# EAGLE design dmxbox2 (EAGLE 9.6.2)
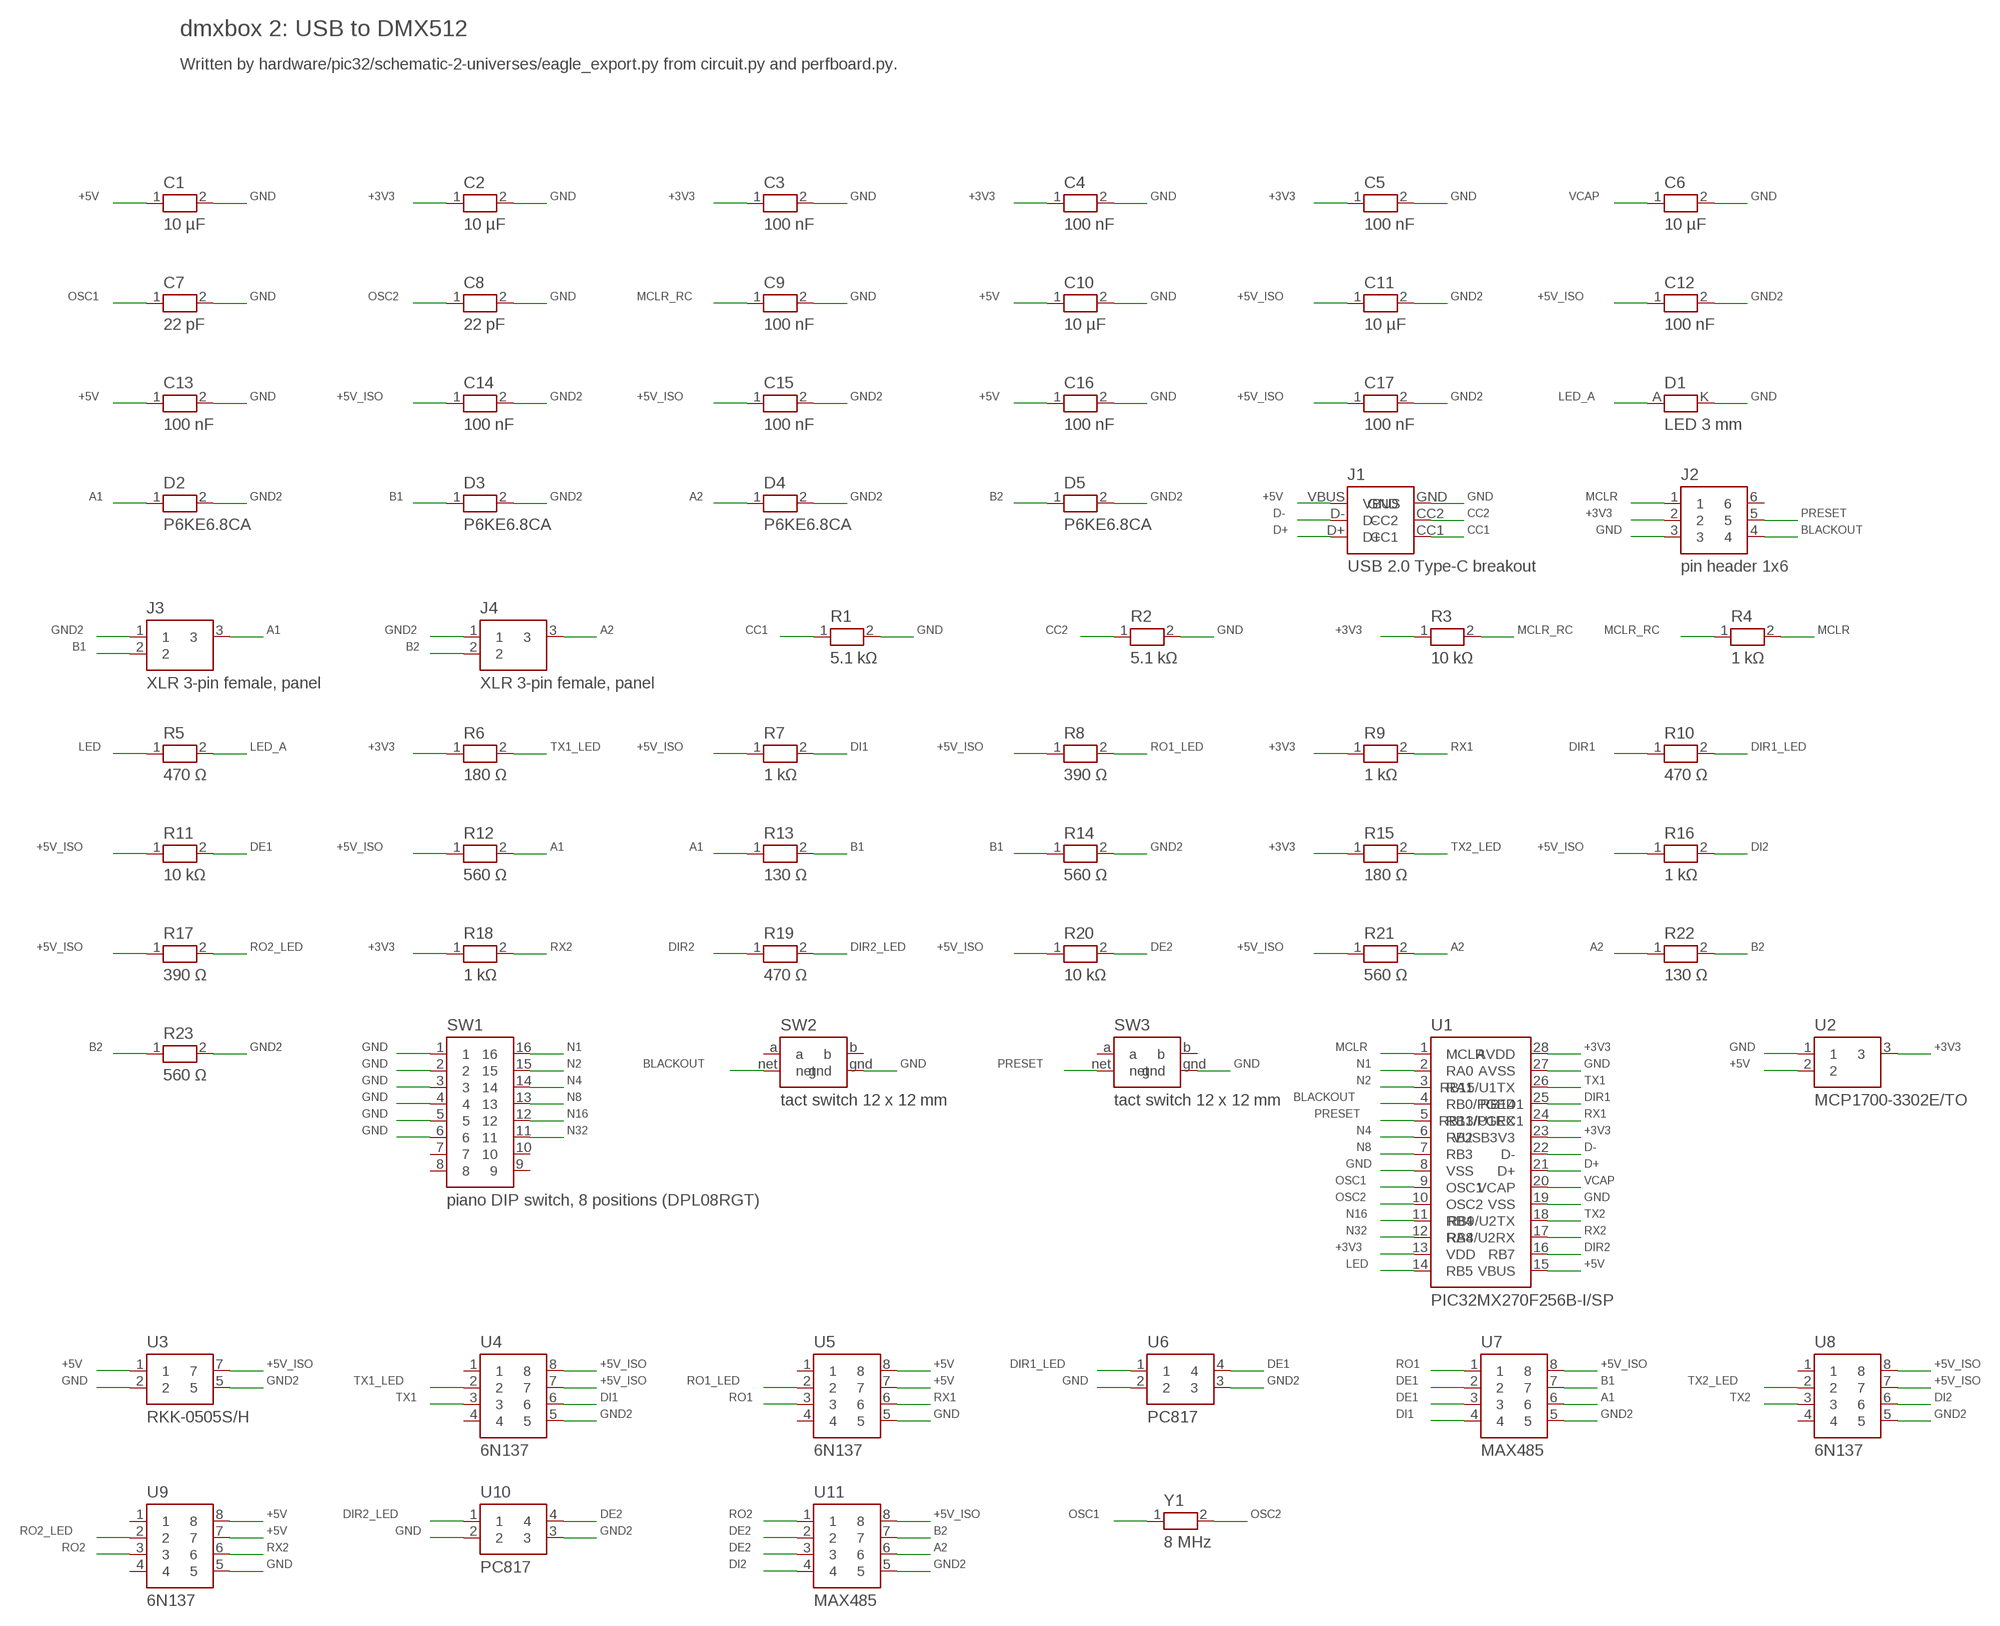
[diagram p0: schematic, sheet 1]

## Parts
C1  10 µF  C_5.08  [C_5.08]
C2  10 µF  C_5.08  [C_5.08]
C3  100 nF  C_5.08  [C_5.08]
C4  100 nF  C_5.08  [C_5.08]
C5  100 nF  C_5.08  [C_5.08]
C6  10 µF  C_5.08  [C_5.08]
C7  22 pF  C_5.08  [C_5.08]
C8  22 pF  C_5.08  [C_5.08]
C9  100 nF  C_5.08  [C_5.08]
C10  10 µF  C_5.08  [C_5.08]
C11  10 µF  C_5.08  [C_5.08]
C12  100 nF  C_5.08  [C_5.08]
C13  100 nF  C_5.08  [C_5.08]
C14  100 nF  C_5.08  [C_5.08]
C15  100 nF  C_5.08  [C_5.08]
C16  100 nF  C_5.08  [C_5.08]
C17  100 nF  C_5.08  [C_5.08]
D1  LED 3 mm  LED_3MM  [LED_3MM]
D2  P6KE6.8CA  DO15_12.70  [DO15_12.70]
D3  P6KE6.8CA  DO15_12.70  [DO15_12.70]
D4  P6KE6.8CA  DO15_12.70  [DO15_12.70]
D5  P6KE6.8CA  DO15_12.70  [DO15_12.70]
J1  USB 2.0 Type-C breakout  USB_C_BREAKOUT_1X6  [USB_C_BREAKOUT_1X6]
J2  pin header 1x6  HEADER_1X6  [HEADER_1X6]
J3  XLR 3-pin female, panel  TERMINAL_3_5.08  [TERMINAL_3_5.08]
J4  XLR 3-pin female, panel  TERMINAL_3_5.08  [TERMINAL_3_5.08]
R1  5.1 kΩ  R_10.16  [R_10.16]
R2  5.1 kΩ  R_10.16  [R_10.16]
R3  10 kΩ  R_10.16  [R_10.16]
R4  1 kΩ  R_5.08_STANDING  [R_5.08_STANDING]
R5  470 Ω  R_10.16  [R_10.16]
R6  180 Ω  R_10.16  [R_10.16]
R7  1 kΩ  R_5.08_STANDING  [R_5.08_STANDING]
R8  390 Ω  R_10.16  [R_10.16]
R9  1 kΩ  R_10.16  [R_10.16]
R10  470 Ω  R_7.62  [R_7.62]
R11  10 kΩ  R_10.16  [R_10.16]
R12  560 Ω  R_10.16  [R_10.16]
R13  130 Ω  R_10.16  [R_10.16]
R14  560 Ω  R_10.16  [R_10.16]
R15  180 Ω  R_10.16  [R_10.16]
R16  1 kΩ  R_5.08_STANDING  [R_5.08_STANDING]
R17  390 Ω  R_10.16  [R_10.16]
R18  1 kΩ  R_7.62  [R_7.62]
R19  470 Ω  R_7.62  [R_7.62]
R20  10 kΩ  R_10.16  [R_10.16]
R21  560 Ω  R_10.16  [R_10.16]
R22  130 Ω  R_10.16  [R_10.16]
R23  560 Ω  R_10.16  [R_10.16]
SW1  piano DIP switch, 8 positions (DPL08RGT)  PIANO_DIP_SWITCH_8  [PIANO_DIP_SWITCH_8]
SW2  tact switch 12 x 12 mm  BUTTON_12MM  [BUTTON_12MM]
SW3  tact switch 12 x 12 mm  BUTTON_12MM  [BUTTON_12MM]
U1  PIC32MX270F256B-I/SP  PIC32MX270F256B_DIP28  [PIC32MX270F256B_DIP28]
U2  MCP1700-3302E/TO  MCP1700_TO92  [MCP1700_TO92]
U3  RKK-0505S/H  RKK0505SH_SIP7  [RKK0505SH_SIP7]
U4  6N137  6N137_DIP8  [6N137_DIP8]
U5  6N137  6N137_DIP8  [6N137_DIP8]
U6  PC817  PC817_DIP4  [PC817_DIP4]
U7  MAX485  MAX485_DIP8  [MAX485_DIP8]
U8  6N137  6N137_DIP8  [6N137_DIP8]
U9  6N137  6N137_DIP8  [6N137_DIP8]
U10  PC817  PC817_DIP4  [PC817_DIP4]
U11  MAX485  MAX485_DIP8  [MAX485_DIP8]
Y1  8 MHz  HC49_CRYSTAL  [HC49_CRYSTAL]

## Nets
+3V3: C2.1 C3.1 C4.1 C5.1 J2.2 R3.1 R6.1 R9.1 R15.1 R18.1 U1.13(VDD) U1.23(VUSB3V3) U1.28(AVDD) U2.3
+5V: C1.1 C10.1 C13.1 C16.1 J1.VBUS U1.15(VBUS) U2.2 U3.1 U5.7 U5.8 U9.7 U9.8
+5V_ISO: C11.1 C12.1 C14.1 C15.1 C17.1 R7.1 R8.1 R11.1 R12.1 R16.1 R17.1 R20.1 R21.1 U3.7 U4.7 U4.8 U7.8 U8.7 U8.8 U11.8
A1: D2.1 J3.3 R12.2 R13.1 U7.6
A2: D4.1 J4.3 R21.2 R22.1 U11.6
B1: D3.1 J3.2 R13.2 R14.1 U7.7
B2: D5.1 J4.2 R22.2 R23.1 U11.7
BLACKOUT: J2.4 SW2.net U1.4(RB0/PGED1)
CC1: J1.CC1 R1.1
CC2: J1.CC2 R2.1
D+: J1.D+ U1.21(D+)
D-: J1.D- U1.22(D-)
DE1: R11.2 U6.4 U7.2 U7.3
DE2: R20.2 U10.4 U11.2 U11.3
DI1: R7.2 U4.6 U7.4
DI2: R16.2 U8.6 U11.4
DIR1: R10.1 U1.25(RB14)
DIR1_LED: R10.2 U6.1
DIR2: R19.1 U1.16(RB7)
DIR2_LED: R19.2 U10.1
GND: C1.2 C2.2 C3.2 C4.2 C5.2 C6.2 C7.2 C8.2 C9.2 C10.2 C13.2 C16.2 D1.K J1.GND J2.3 R1.2 R2.2 SW1.1 SW1.2 SW1.3 SW1.4 SW1.5 SW1.6 SW2.gnd SW3.gnd U1.8(VSS) U1.19(VSS) U1.27(AVSS) U2.1 U3.2 U5.5 U6.2 U9.5 U10.2
GND2: C11.2 C12.2 C14.2 C15.2 C17.2 D2.2 D3.2 D4.2 D5.2 J3.1 J4.1 R14.2 R23.2 U3.5 U4.5 U6.3 U7.5 U8.5 U10.3 U11.5
LED: R5.1 U1.14(RB5)
LED_A: D1.A R5.2
MCLR: J2.1 R4.2 U1.1(MCLR)
MCLR_RC: C9.1 R3.2 R4.1
N1: SW1.16 U1.2(RA0)
N2: SW1.15 U1.3(RA1)
N4: SW1.14 U1.6(RB2)
N8: SW1.13 U1.7(RB3)
N16: SW1.12 U1.11(RB4)
N32: SW1.11 U1.12(RA4)
OSC1: C7.1 U1.9(OSC1) Y1.1
OSC2: C8.1 U1.10(OSC2) Y1.2
PRESET: J2.5 SW3.net U1.5(RB1/PGEC1)
RO1: U5.3 U7.1
RO1_LED: R8.2 U5.2
RO2: U9.3 U11.1
RO2_LED: R17.2 U9.2
RX1: R9.2 U1.24(RB13/U1RX) U5.6
RX2: R18.2 U1.17(RB8/U2RX) U9.6
TX1: U1.26(RB15/U1TX) U4.3
TX1_LED: R6.2 U4.2
TX2: U1.18(RB9/U2TX) U8.3
TX2_LED: R15.2 U8.2
VCAP: C6.1 U1.20(VCAP)
Unconnected: J2.6 SW1.7 SW1.8 SW1.9 SW1.10 SW2.a SW2.b SW3.a SW3.b U4.1 U4.4 U5.1 U5.4 U8.1 U8.4 U9.1 U9.4

## Notes on the sheet
- dmxbox 2: USB to DMX512
- Written by hardware/pic32/schematic-2-universes/eagle_export.py from circuit.py and perfboard.py.

## Library data of the parts
C1-C17 = lumenet:C_5.08
D1 = lumenet:LED_3MM
D2-D5 = lumenet:DO15_12.70
J1 = lumenet:USB_C_BREAKOUT_1X6
J2 = lumenet:HEADER_1X6
J3 J4 = lumenet:TERMINAL_3_5.08
R1-R3 R5 R6 R8 R9 R11-R15 R17 R20-R23 = lumenet:R_10.16
R4 R7 R16 = lumenet:R_5.08_STANDING
R10 R18 R19 = lumenet:R_7.62
SW1 = lumenet:PIANO_DIP_SWITCH_8
SW2 SW3 = lumenet:BUTTON_12MM
U1 = lumenet:PIC32MX270F256B_DIP28
U2 = lumenet:MCP1700_TO92
U3 = lumenet:RKK0505SH_SIP7
U4 U5 U8 U9 = lumenet:6N137_DIP8
U6 U10 = lumenet:PC817_DIP4
U7 U11 = lumenet:MAX485_DIP8
Y1 = lumenet:HC49_CRYSTAL

## Board
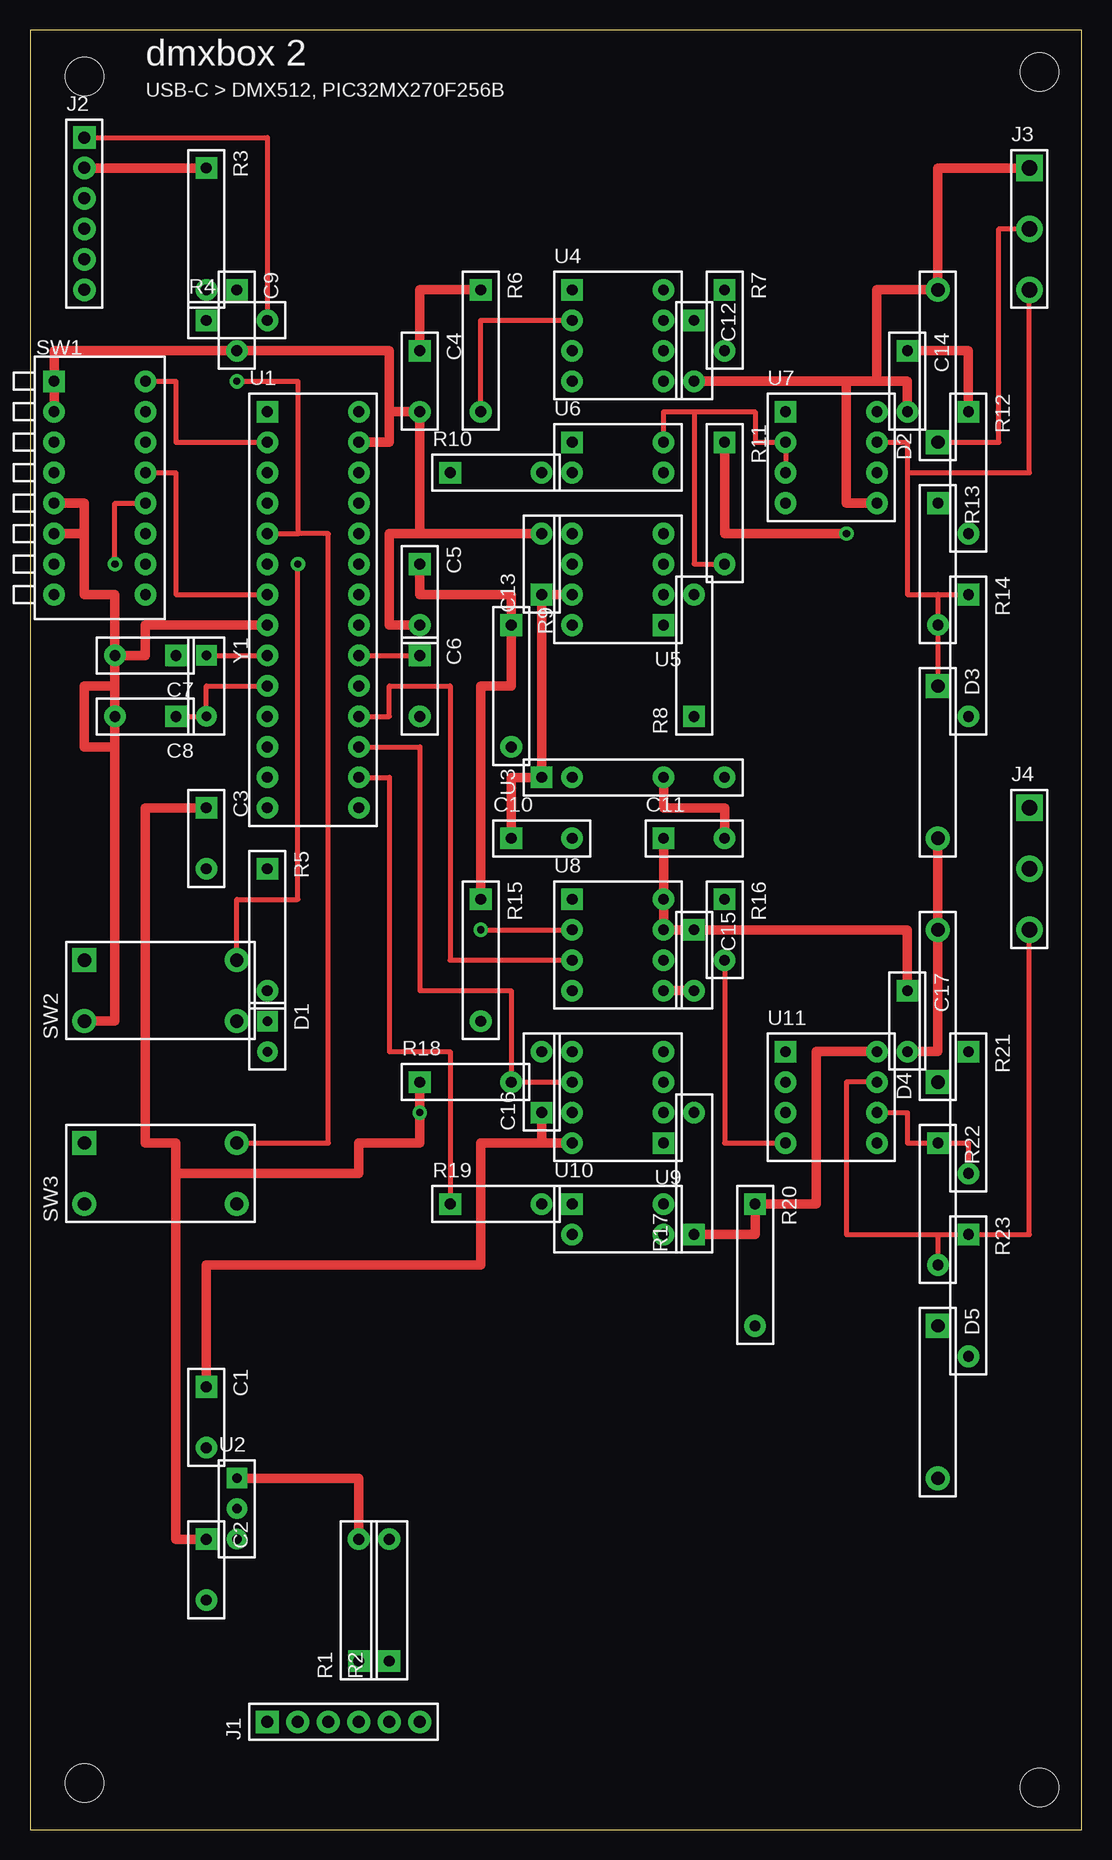
[diagram p1: board, top side]
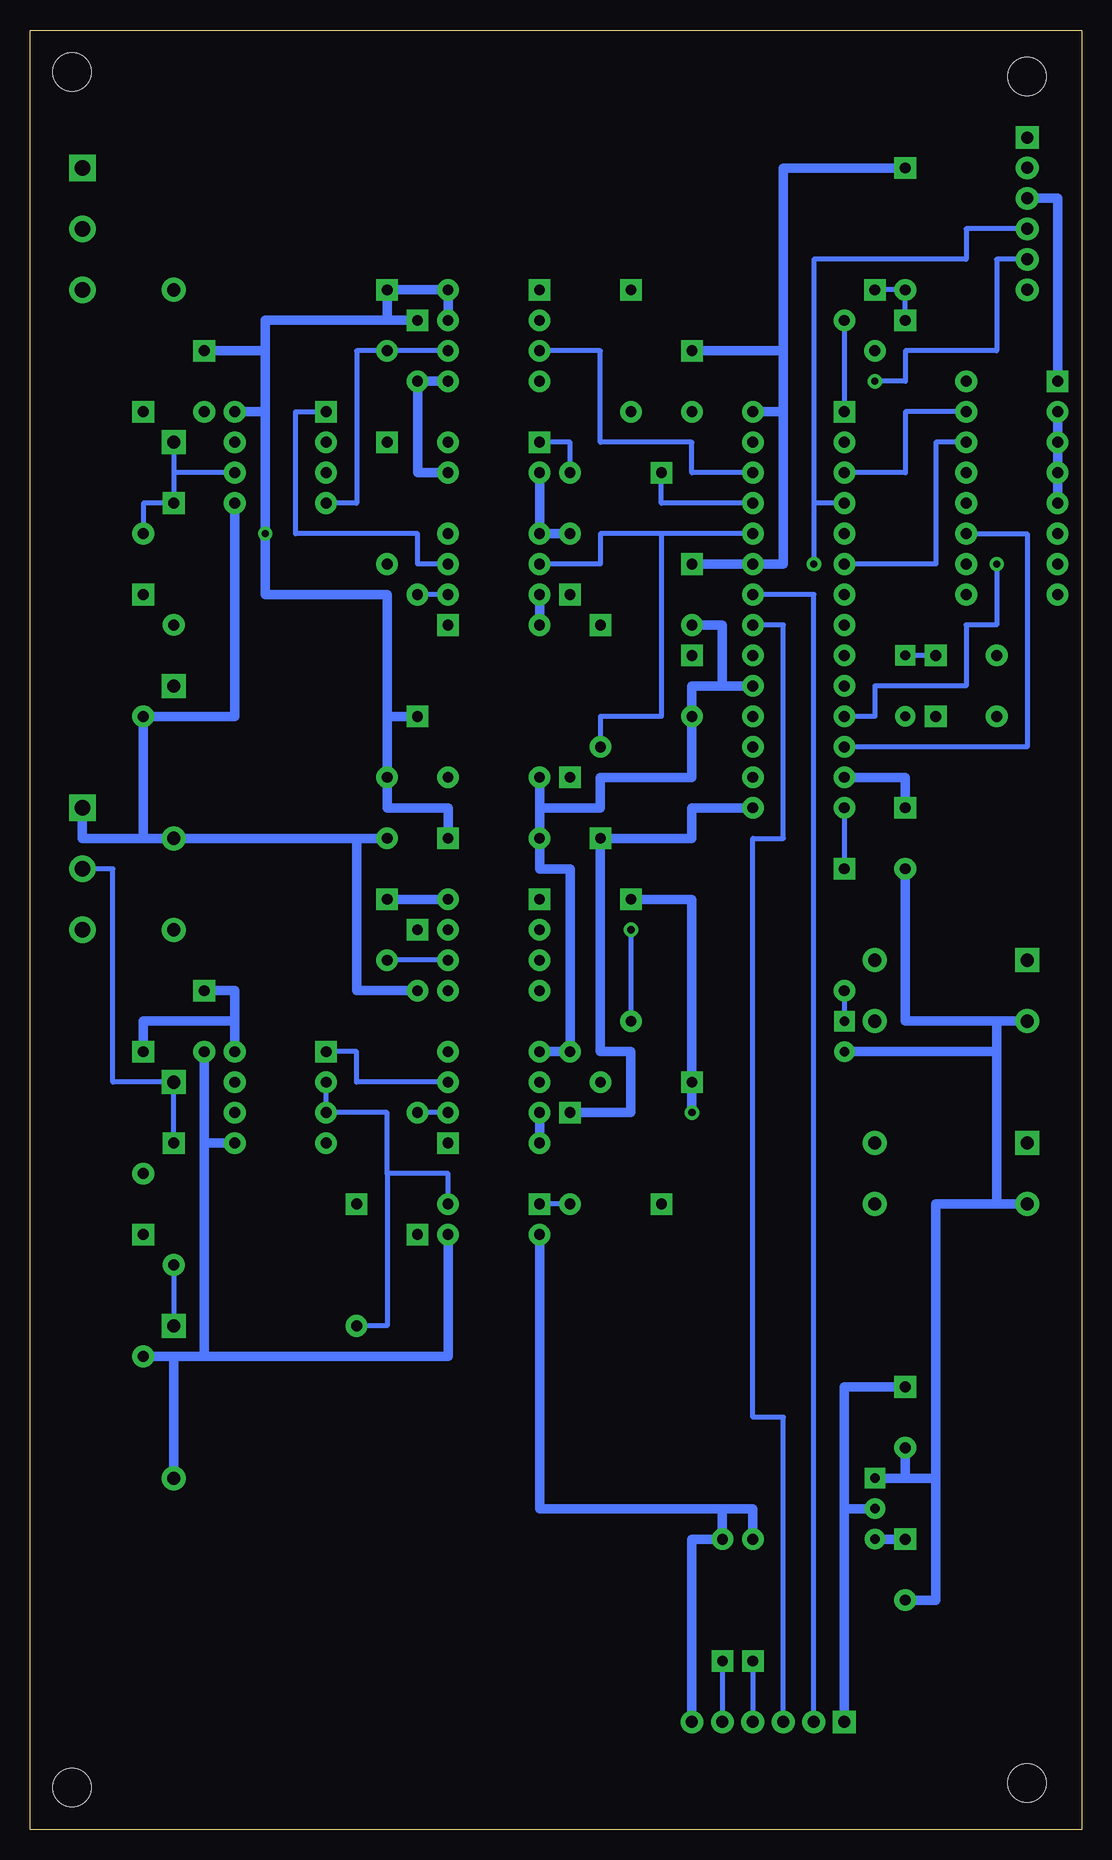
[diagram p2: board, bottom side, seen from below]

Size 87.64 x 150 mm. Coordinates in mm from the lower left corner, seen from the top.
Outline: 0,0 87.64,0 87.64,150 0,150 0,0
Copper layers used: Top, Bottom
Holes 3.2 mm at 4.54,146.12 4.54,3.88 84.14,3.5 84.14,146.5

### Footprints (pad centres in the part's own frame; a part is rotated, then mirrored left to right if it is on the bottom)
C_5.08 = drill 0.9 pad 1.8 square: 1 0,0 | drill 0.9 pad 1.8 round: 2 5.08,0
LED_3MM = drill 0.8 pad 1.7 square: A 0,0 | drill 0.8 pad 1.7 round: K 2.54,0
DO15_12.70 = drill 1.1 pad 2 square: 1 0,0 | drill 1.1 pad 2 round: 2 12.7,0
USB_C_BREAKOUT_1X6 = drill 1 pad 1.9 round: CC1 0,-7.62; CC2 0,-10.16; D+ 0,-5.08; D- 0,-2.54; GND 0,-12.7 | drill 1 pad 1.9 square: VBUS 0,0
HEADER_1X6 = drill 1 pad 1.9 square: 1 0,0 | drill 1 pad 1.9 round: 2 0,-2.54; 3 0,-5.08; 4 0,-7.62; 5 0,-10.16; 6 0,-12.7
TERMINAL_3_5.08 = drill 1.3 pad 2.2 square: 1 0,0 | drill 1.3 pad 2.2 round: 2 0,-10.16; 3 0,-5.08
R_10.16 = drill 0.9 pad 1.8 square: 1 0,0 | drill 0.9 pad 1.8 round: 2 10.16,0
R_5.08_STANDING = drill 0.9 pad 1.8 square: 1 0,0 | drill 0.9 pad 1.8 round: 2 5.08,0
R_7.62 = drill 0.9 pad 1.8 square: 1 0,0 | drill 0.9 pad 1.8 round: 2 7.62,0
PIANO_DIP_SWITCH_8 = drill 0.9 pad 1.8 square: 1 0,0 | drill 0.9 pad 1.8 round: 2 0,-2.54; 3 0,-5.08; 4 0,-7.62; 5 0,-10.16; 6 0,-12.7; 7 0,-15.24; 8 0,-17.78; 9 7.62,-17.78; 10 7.62,-15.24; 11 7.62,-12.7; 12 7.62,-10.16; 13 7.62,-7.62; 14 7.62,-5.08; 15 7.62,-2.54; 16 7.62,0
BUTTON_12MM = drill 1.1 pad 2 square: a 0,0 | drill 1.1 pad 2 round: b -5.08,-12.7; gnd -5.08,0; net 0,-12.7
PIC32MX270F256B_DIP28 = drill 0.9 pad 1.8 square: 1 0,0 | drill 0.9 pad 1.8 round: 2 0,-2.54; 3 0,-5.08; 4 0,-7.62; 5 0,-10.16; 6 0,-12.7; 7 0,-15.24; 8 0,-17.78; 9 0,-20.32; 10 0,-22.86; 11 0,-25.4; 12 0,-27.94; 13 0,-30.48; 14 0,-33.02; 15 7.62,-33.02; 16 7.62,-30.48; 17 7.62,-27.94; 18 7.62,-25.4; 19 7.62,-22.86; 20 7.62,-20.32; 21 7.62,-17.78; 22 7.62,-15.24; 23 7.62,-12.7; 24 7.62,-10.16; 25 7.62,-7.62; 26 7.62,-5.08; 27 7.62,-2.54; 28 7.62,0
MCP1700_TO92 = drill 0.8 pad 1.7 square: 1 0,0 | drill 0.8 pad 1.7 round: 2 0,-2.54; 3 0,-5.08
RKK0505SH_SIP7 = drill 0.9 pad 1.8 square: 1 0,0 | drill 0.9 pad 1.8 round: 2 0,-2.54; 5 0,-10.16; 7 0,-15.24
6N137_DIP8 = drill 0.9 pad 1.8 square: 1 0,0 | drill 0.9 pad 1.8 round: 2 0,-2.54; 3 0,-5.08; 4 0,-7.62; 5 7.62,-7.62; 6 7.62,-5.08; 7 7.62,-2.54; 8 7.62,0
PC817_DIP4 = drill 0.9 pad 1.8 square: 1 0,0 | drill 0.9 pad 1.8 round: 2 0,-2.54; 3 7.62,-2.54; 4 7.62,0
MAX485_DIP8 = drill 0.9 pad 1.8 square: 1 0,0 | drill 0.9 pad 1.8 round: 2 0,-2.54; 3 0,-5.08; 4 0,-7.62; 5 7.62,-7.62; 6 7.62,-5.08; 7 7.62,-2.54; 8 7.62,0
HC49_CRYSTAL = drill 0.8 pad 1.7 square: 1 0,0 | drill 0.8 pad 1.7 round: 2 5.08,0

### Placement (x,y rotation side)
C1  14.7,36.9 270 top
C2  14.7,24.2 270 top
C3  14.7,85.16 270 top
C4  32.48,123.26 270 top
C5  32.48,105.48 270 top
C6  32.48,97.86 270 top
C7  12.16,97.86 180 top
C8  12.16,92.78 180 top
C9  17.24,128.34 270 top
C10  40.1,82.62 0 top
C11  52.8,82.62 0 top
C12  55.34,125.8 270 top
C13  42.64,102.94 90 top
C14  73.12,123.26 270 top
C15  55.34,75 270 top
C16  42.64,59.76 90 top
C17  73.12,69.92 270 top
D1  19.78,67.38 270 top
D2  75.66,115.64 90 top
D3  75.66,95.32 270 top
D4  75.66,62.3 90 top
D5  75.66,41.98 270 top
J1  19.78,8.96 90 top
J2  4.54,141.04 0 top
J3  83.28,138.5 0 top
J4  83.28,85.16 0 top
R1  27.4,14.04 90 top
R2  29.94,14.04 90 top
R3  14.7,138.5 270 top
R4  14.7,125.8 0 top
R5  19.78,80.08 270 top
R6  37.56,128.34 270 top
R7  57.88,128.34 270 top
R8  55.34,92.78 90 top
R9  40.1,100.4 270 top
R10  35.02,113.1 0 top
R11  57.88,115.64 270 top
R12  78.2,118.18 270 top
R13  75.66,110.56 270 top
R14  78.2,102.94 270 top
R15  37.56,77.54 270 top
R16  57.88,77.54 270 top
R17  55.34,49.6 90 top
R18  32.48,62.3 0 top
R19  35.02,52.14 0 top
R20  60.42,52.14 270 top
R21  78.2,64.84 270 top
R22  75.66,57.22 270 top
R23  78.2,49.6 270 top
SW1  2,120.72 0 top
SW2  4.54,72.46 90 top
SW3  4.54,57.22 90 top
U1  19.78,118.18 0 top
U2  17.24,29.28 0 top
U3  42.64,87.7 90 top
U4  45.18,128.34 0 top
U5  52.8,100.4 180 top
U6  45.18,115.64 0 top
U7  62.96,118.18 0 top
U8  45.18,77.54 0 top
U9  52.8,57.22 180 top
U10  45.18,52.14 0 top
U11  62.96,64.84 0 top
Y1  14.7,97.86 270 top

### Tracks (layer width: path | path; a pad name or v marks a point on that pad's centre or on a via)
+3V3  (via drill 0.6 pad 1.2)
  Top 0.8: J2.2 R3.1 | 12.16,54.68 12.16,57.22 9.62,57.22 9.62,85.16 C3.1 | 12.16,54.68 12.16,24.2 C2.1 | 12.16,54.68 27.4,54.68 27.4,57.22 32.48,57.22 R18.1 | C4.1 32.48,128.34 R6.1 | C5.1 32.48,102.94 40.1,102.94 40.1,95.32 37.56,95.32 R15.1
  Bottom 0.8: R3.1 24.86,138.5 24.86,123.26 | C3.1 14.7,87.7 U1.13 | C2.1 U2.3 | 24.86,123.26 24.86,118.18 | 24.86,123.26 C4.1 | 24.86,118.18 24.86,105.48 C5.1 | 24.86,118.18 U1.28 | v32.48,59.76 32.48,77.54 R15.1
+5V
  Top 0.8: C1.1 14.7,47.06 37.56,47.06 37.56,57.22 42.64,57.22 | C10.1 40.1,87.7 U3.1 C13.1 U5.7 | C16.1 42.64,57.22 | 42.64,57.22 U9.8
  Bottom 0.8: C1.1 19.78,36.9 19.78,26.74 | U2.2 19.78,26.74 | 19.78,26.74 J1.VBUS | U1.15 32.48,85.16 32.48,82.62 C10.1 40.1,64.84 37.56,64.84 37.56,59.76 C16.1 | U5.7 U5.8 | U9.7 U9.8
+5V_ISO  (via drill 0.6 pad 1.2)
  Top 0.8: C11.1 U8.7 73.12,75 C17.1 | R17.1 60.42,49.6 R20.1 65.5,52.14 65.5,64.84 U11.8 | R11.1 57.88,108.02 v68.04,108.02 | C14.1 78.2,123.26 R12.1
  Bottom 0.8: U4.7 U4.8 R7.1 57.88,125.8 | C11.1 52.8,85.16 57.88,85.16 57.88,92.78 | U8.8 R16.1 | C12.1 57.88,125.8 | R8.1 57.88,92.78 | 57.88,125.8 68.04,125.8 68.04,123.26 | 57.88,92.78 57.88,102.94 68.04,102.94 68.04,118.18 | 68.04,123.26 68.04,118.18 | 68.04,123.26 C14.1 | 68.04,118.18 U7.8 | 70.58,67.38 70.58,69.92 C17.1 | 70.58,67.38 U11.8 | 70.58,67.38 78.2,67.38 R21.1
A1
  Top 0.4: D2.1 80.74,115.64 80.74,133.42 J3.3
  Bottom 0.4: U7.6 75.66,113.1 | D2.1 75.66,113.1 | 75.66,113.1 R13.1 78.2,110.56 R12.2
A2
  Top 0.4: U11.6 73.12,59.76 73.12,57.22 78.2,57.22 R21.2
  Bottom 0.4: R22.1 D4.1 80.74,62.3 80.74,80.08 J4.3
B1
  Top 0.4: U7.7 73.12,115.64 73.12,113.1 | 73.12,113.1 73.12,102.94 75.66,102.94 | 73.12,113.1 83.28,113.1 J3.2 | 75.66,102.94 D3.1 | 75.66,102.94 R14.1
B2
  Top 0.4: U11.7 68.04,62.3 68.04,49.6 75.66,49.6 | 75.66,49.6 R22.2 | 75.66,49.6 83.28,49.6 J4.2
  Bottom 0.4: R22.2 D5.1
BLACKOUT  (via drill 0.6 pad 1.2)
  Top 0.4: SW2.net 17.24,77.54 22.32,77.54 v22.32,105.48
  Bottom 0.4: J2.4 9.62,133.42 9.62,130.88 22.32,130.88 22.32,110.56 | U1.4 22.32,110.56 | 22.32,110.56 v22.32,105.48
CC1
  Bottom 0.4: R1.1 J1.CC1
CC2
  Bottom 0.4: R2.1 J1.CC2
D+
  Bottom 0.4: J1.D+ 24.86,34.36 27.4,34.36 27.4,82.62 24.86,82.62 24.86,100.4 U1.21
D-
  Bottom 0.4: J1.D- 22.32,102.94 U1.22
DE1
  Top 0.4: U6.4 52.8,118.18 55.34,118.18 | 55.34,118.18 55.34,105.48 R11.2 | 55.34,118.18 60.42,118.18 60.42,115.64 U7.2 U7.3
DE2
  Bottom 0.4: U10.4 52.8,54.68 57.88,54.68 | 57.88,54.68 57.88,59.76 U11.3 U11.2 | 57.88,54.68 57.88,41.98 R20.2
DI1
  Bottom 0.4: U4.6 60.42,123.26 60.42,110.56 U7.4
DI2
  Top 0.4: R16.2 57.88,57.22 U11.4
  Bottom 0.4: U8.6 R16.2
DIR1
  Bottom 0.4: U1.25 35.02,110.56 R10.1
DIR1_LED
  Bottom 0.4: R10.2 42.64,115.64 U6.1
DIR2
  Top 0.4: U1.16 29.94,87.7 29.94,64.84 35.02,64.84 R19.1
DIR2_LED
  Bottom 0.4: R19.2 U10.1
GND
  Top 0.8: SW1.2 2,123.26 29.94,123.26 29.94,118.18 | SW1.5 4.54,110.56 4.54,108.02 | SW1.6 4.54,108.02 | 4.54,108.02 4.54,102.94 7.08,102.94 C7.2 | SW2.gnd 7.08,67.38 7.08,90.24 | C7.2 7.08,95.32 | C7.2 9.62,97.86 9.62,100.4 U1.8 | 7.08,95.32 4.54,95.32 4.54,90.24 7.08,90.24 | 7.08,95.32 7.08,90.24 | U2.1 27.4,29.28 R1.2 | U1.27 29.94,115.64 29.94,118.18 | 29.94,118.18 C4.2 32.48,108.02 | 32.48,108.02 29.94,108.02 29.94,100.4 C5.2 | 32.48,108.02 C13.2
  Bottom 0.8: SW1.1 2,135.96 J2.3 | SW1.2 SW1.5 | SW2.gnd 7.08,67.38 | SW3.gnd 7.08,52.14 | 7.08,67.38 7.08,64.84 | 7.08,67.38 14.7,67.38 C3.2 | 7.08,64.84 7.08,52.14 | 7.08,64.84 D1.K | 7.08,52.14 12.16,52.14 12.16,29.28 | 12.16,29.28 12.16,19.12 C2.2 | 12.16,29.28 14.7,29.28 | C1.2 14.7,29.28 | 14.7,29.28 U2.1 | U1.19 29.94,95.32 | R1.2 27.4,26.74 29.94,26.74 | 29.94,95.32 29.94,100.4 C5.2 | 29.94,95.32 32.48,95.32 32.48,87.7 40.1,87.7 40.1,85.16 45.18,85.16 | 29.94,26.74 R2.2 32.48,24.2 J1.GND | 29.94,26.74 45.18,26.74 U10.2 | C13.2 U5.5 U6.2 | U3.2 45.18,85.16 | 45.18,85.16 45.18,80.08 42.64,80.08 C16.2 U9.5
GND2
  Top 0.8: U3.5 52.8,85.16 57.88,85.16 C11.2 | U8.5 C15.2 | C12.2 68.04,120.72 | 68.04,120.72 68.04,110.56 U7.5 | 68.04,120.72 70.58,120.72 | 70.58,120.72 70.58,128.34 D2.2 75.66,138.5 J3.1 | 70.58,120.72 73.12,120.72 C14.2 | C17.2 75.66,64.84 D3.2
  Bottom 0.8: U4.5 C12.2 55.34,113.1 U6.3 | U10.3 52.8,39.44 73.12,39.44 | C15.2 60.42,69.92 60.42,82.62 | C11.2 60.42,82.62 | 60.42,82.62 78.2,82.62 | U7.5 70.58,92.78 R14.2 78.2,82.62 | U11.5 73.12,57.22 | C17.2 73.12,57.22 | 73.12,57.22 73.12,39.44 | 73.12,39.44 75.66,39.44 | 75.66,39.44 D5.2 | 75.66,39.44 R23.2 | 78.2,82.62 83.28,82.62 J4.1
LED
  Bottom 0.4: U1.14 R5.1
LED_A
  Bottom 0.4: R5.2 D1.A
MCLR
  Top 0.4: J2.1 19.78,141.04 R4.2
  Bottom 0.4: R4.2 U1.1
MCLR_RC
  Bottom 0.4: R4.1 R3.2 C9.1
N1
  Top 0.4: SW1.16 12.16,120.72 12.16,115.64 U1.2
N2
  Bottom 0.4: SW1.15 14.7,118.18 14.7,113.1 U1.3
N4
  Bottom 0.4: SW1.14 12.16,115.64 12.16,105.48 U1.6
N8
  Top 0.4: SW1.13 12.16,113.1 12.16,102.94 U1.7
N16  (via drill 0.6 pad 1.2)
  Top 0.4: v7.08,105.48 7.08,110.56 SW1.12
  Bottom 0.4: v7.08,105.48 7.08,100.4 9.62,100.4 9.62,95.32 17.24,95.32 17.24,92.78 U1.11
N32
  Bottom 0.4: SW1.11 4.54,108.02 4.54,90.24 U1.12
OSC1
  Top 0.4: Y1.1 U1.9
  Bottom 0.4: C7.1 Y1.1
OSC2
  Top 0.4: C8.1 Y1.2 14.7,95.32 U1.10
PRESET  (via drill 0.6 pad 1.2)
  Top 0.4: v17.24,120.72 22.32,120.72 22.32,108.02 | SW3.net 24.86,57.22 24.86,108.02 22.32,108.02 | U1.5 22.32,108.02
  Bottom 0.4: J2.5 7.08,130.88 7.08,123.26 14.7,123.26 14.7,120.72 v17.24,120.72
RO1
  Bottom 0.4: U5.3 55.34,105.48 55.34,108.02 65.5,108.02 65.5,118.18 U7.1
RO1_LED
  Bottom 0.4: U5.2 R8.2
RO2
  Bottom 0.4: U9.3 60.42,62.3 60.42,64.84 U11.1
RO2_LED
  Bottom 0.4: U9.2 R17.2
RX1
  Bottom 0.4: U1.24 35.02,108.02 | 35.02,108.02 35.02,92.78 40.1,92.78 R9.2 | 35.02,108.02 40.1,108.02 40.1,105.48 U5.6
RX2
  Top 0.4: U1.17 32.48,90.24 32.48,69.92 40.1,69.92 R18.2 U9.6
TX1
  Bottom 0.4: U1.26 32.48,113.1 32.48,115.64 40.1,115.64 40.1,123.26 U4.3
TX1_LED
  Top 0.4: R6.2 37.56,125.8 U4.2
TX2
  Top 0.4: U1.18 29.94,92.78 29.94,95.32 35.02,95.32 35.02,72.46 U8.3
TX2_LED  (via drill 0.6 pad 1.2)
  Top 0.4: v37.56,75 U8.2
  Bottom 0.4: v37.56,75 R15.2
VCAP
  Top 0.4: U1.20 C6.1

### Text on the board
tPlace: dmxbox 2 | USB-C > DMX512, PIC32MX270F256B